# Altium schematic sheet Accelerometer.SchDoc
size A; SheetNumber: 4; SheetTotal: 6
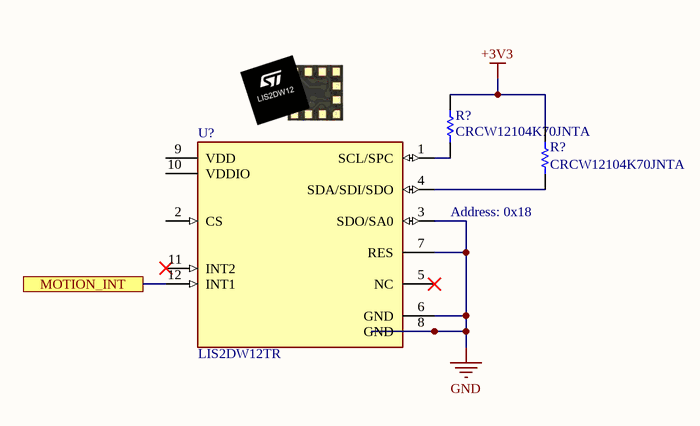
[diagram p0: Accelerometer.SchDoc]

## Parts
(Parts that share a designator on the sheet are numbered #1, #2 ... from top to bottom, then left to right.)
R?#1  CRCW12104K70JNTA  [RESC3225X60X45ML20T20]
R?#2  CRCW12104K70JNTA  [RESC3225X60X45ML20T20]
U?  LIS2DW12TR  [FP-LGA12-DM00170568-MFG]

## Ports
MOTION_INT

## Nets
+3V3: R?#1.2 R?#2.2
GND: U?.3(SDO/SA0) U?.6(GND) U?.7(RES) U?.8(GND)
MOTION_INT: U?.12(INT1) ; port MOTION_INT
NetR?#1_1: R?#1.1 U?.1(SCL/SPC)
NetR?#2_1: R?#2.1 U?.4(SDA/SDI/SDO)

Not connected (* = marked no-connect by the designer): U? 2(CS) 5(NC)* 9(VDD) 10(VDDIO) 11(INT2)*

## Notes on the sheet
- Address: 0x18

## Library data of the parts
R?#1 R?#2 = CMP-2005-00822-1: 4.7k ohm; Manufacturer: Vishay Dale; Part Number: CRCW12104K70JNTA
U? = CMP-12175-000006-1: ACCEL 2-16G I2C/SPI 12LGA; Manufacturer: STMicroelectronics; Min Supply Voltage: 1.62V; Operating Supply Current: 0.38-90uA; Sensor Output: I2C,SPI; Accel Resolution: 14bits; Max Supply Voltage: 3.6V; Accel Range: 2/4/8/16g; Height: 0.7mm; Device Class L1: Sensors; RoHS: TRUE; Temperature Range Low: -40°C; Category: IC; Mouser Description: Accelerometer Triple ±2g/±4g/±8g/±16g 1.62V to 3.6V 0.244mg/digit/0.488mg/digit/0.976mg/digit/1.952mg/digit 12-Pin LG...; Digikey Description: ACCEL 2-16G I2C/SPI 12LGA; ComponentLink2URL: https://www.st.com/resource/en/datasheet/lis2dw12.pdf; Automotive: No; Manufacturer Part Number: LIS2DW12TR; Lead Free: Yes; Footprint Url: https://www.st.com/content/ccc/resource/technical/document/technical_note/73/17/9c/16/dd/96/4a/01/CD00134799.pdf/files/CD00134799.pdf/jcr:content/translations/en.CD00134799.pdf; Temperature: -40°C to +85°C; Device Class L3: Accelerometers; Package: LGA12-DM00170568; Temperature Range High: +85°C; Device Class L2: Motion Sensors; Octopart: https://octopart.com/lis2dw12tr-stmicroelectronics-77080925; ComponentLink2Description: Datasheet